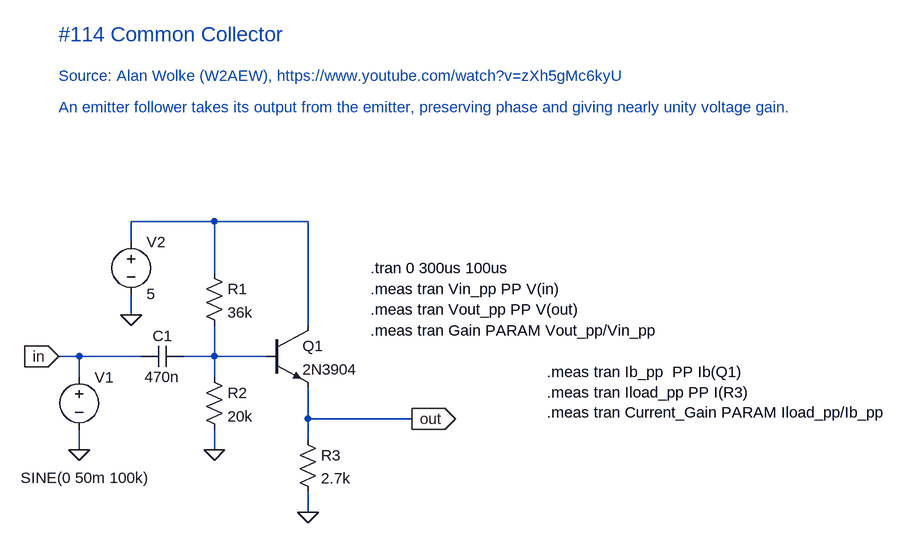
[diagram p0: schematic Common Collector.asc]
Common Collector.asc, the LTspice schematic file:
Version 4.1
SHEET 1 1648 680
WIRE 560 -112 432 -112
WIRE 704 -112 560 -112
WIRE 432 -80 432 -112
WIRE 560 -32 560 -112
WIRE 432 32 432 0
WIRE 704 48 704 -112
WIRE 352 96 320 96
WIRE 448 96 352 96
WIRE 560 96 560 48
WIRE 560 96 512 96
WIRE 640 96 560 96
WIRE 352 128 352 96
WIRE 560 128 560 96
WIRE 704 192 704 144
WIRE 704 224 704 192
WIRE 864 192 704 192
WIRE 352 240 352 208
WIRE 560 240 560 208
WIRE 704 336 704 304
FLAG 432 32 0
FLAG 352 240 0
FLAG 704 336 0
FLAG 560 240 0
FLAG 320 96 in
IOPIN 320 96 In
SYMBOL voltage 432 -96 R0
WINDOW 123 0 0 Left 0
WINDOW 39 0 0 Left 0
SYMATTR InstName V2
SYMATTR Value 5
SYMBOL voltage 352 112 R0
WINDOW 3 -90 171 Left 2
WINDOW 123 0 0 Left 0
WINDOW 39 0 0 Left 0
SYMATTR Value SINE(0 50m 100k)
SYMATTR InstName V1
SYMBOL res 544 -48 R0
SYMATTR InstName R1
SYMATTR Value 36k
SYMBOL res 544 112 R0
SYMATTR InstName R2
SYMATTR Value 20k
SYMBOL npn 640 48 R0
SYMATTR InstName Q1
SYMATTR Value 2N3904
SYMBOL res 688 208 R0
SYMATTR InstName R3
SYMATTR Value 2.7k
SYMBOL cap 512 80 R90
WINDOW 0 0 32 VBottom 2
WINDOW 3 32 32 VTop 2
SYMATTR InstName C1
SYMATTR Value 470n
FLAG 864 192 out
IOPIN 864 192 Out
TEXT 800 -40 Left 2 !.tran 0 300us 100us
TEXT 800 -8 Left 2 !.meas tran Vin_pp PP V(in)
TEXT 800 24 Left 2 !.meas tran Vout_pp PP V(out)
TEXT 800 56 Left 2 !.meas tran Gain PARAM Vout_pp/Vin_pp
TEXT 1072 120 Left 2 !.meas tran Ib_pp  PP Ib(Q1)\n.meas tran Iload_pp PP I(R3)\n.meas tran Current_Gain PARAM Iload_pp/Ib_pp
TEXT 320 -400 Left 3 ;#114 Common Collector
TEXT 320 -336 Left 2 ;Source: Alan Wolke (W2AEW), https://www.youtube.com/watch?v=zXh5gMc6kyU
TEXT 320 -288 Left 2 ;An emitter follower takes its output from the emitter, preserving phase and giving nearly unity voltage gain.

The netlist it stands for:
* Common Collector.asc
V2 N001 0 5
V1 in 0 SINE(0 50m 100k)
R1 N001 N002 36k
R2 N002 0 20k
Q1 N001 N002 out 0 2N3904
R3 out 0 2.7k
C1 N002 in 470n
.model NPN NPN
.model PNP PNP
.lib standard.bjt
.tran 0 300us 100us
.meas tran Vin_pp PP V(in)
.meas tran Vout_pp PP V(out)
.meas tran Gain PARAM Vout_pp/Vin_pp
.meas tran Ib_pp  PP Ib(Q1)
.meas tran Iload_pp PP I(R3)
.meas tran Current_Gain PARAM Iload_pp/Ib_pp
* #114 Common Collector
* Source: Alan Wolke (W2AEW), https://www.youtube.com/watch?v=zXh5gMc6kyU
* An emitter follower takes its output from the emitter, preserving phase and giving nearly unity voltage gain.
.backanno
.end